# Altium project LTE-GNSS Asset Tracker.PrjPcb (part 2 of 3)

## Sheet 3-LTE Module.SchDoc: LTE Module
size A4; Organization: Unival Logistics; Address1: 550 S Hill St.; Address2: Suite 1607; Address3: Los Angeles, CA 90013; Revision: A; SheetNumber: 4; SheetTotal: 6
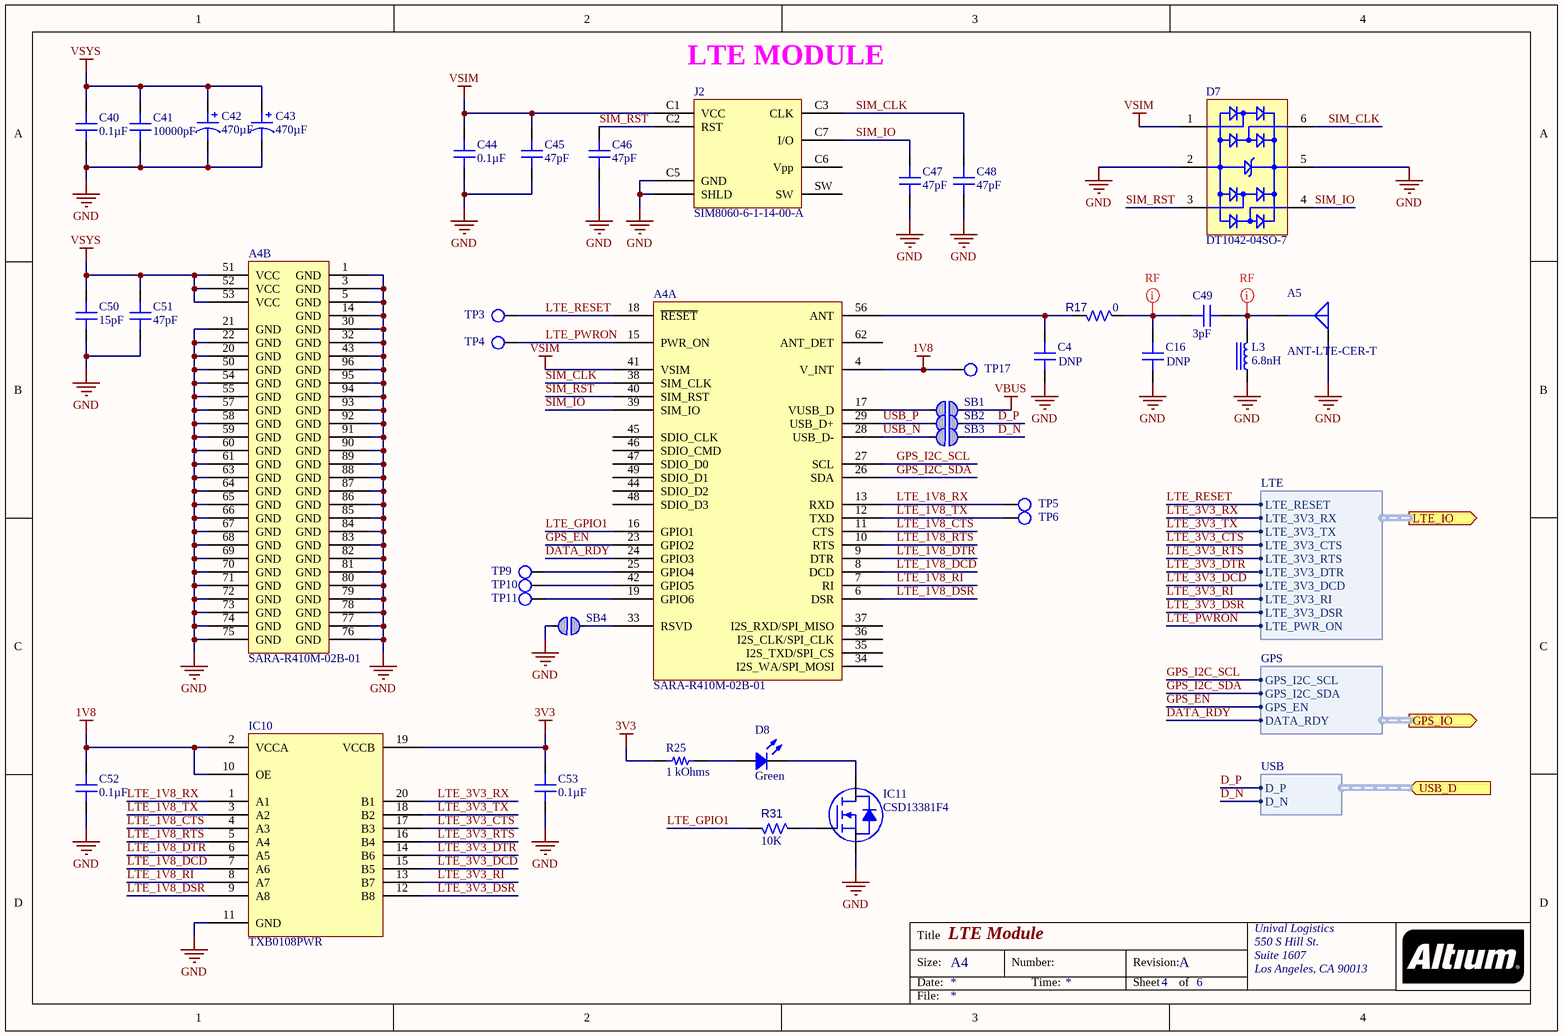
[diagram p2: 3-LTE Module.SchDoc]

### Parts
A4  SARA-R410M-02B-01  [U-BLOX SARA-R4]  (parts A,B of 2)
A5  ANT-LTE-CER-T  [LINX ANT-LTE-CER-T]
C4  DNP  [CAP 0402_1005]
C16  DNP  [CAP 0402_1005]
C40  0.1µF  [CAP 0201_0603]
C41  10000pF  [CAP 0201_0603]
C42  470µF  [CAP POL 1411_3528]
C43  470µF  [CAP POL 1411_3528]
C44  0.1µF  [CAP 0201_0603]
C45  47pF  [CAP 0201_0603]
C46  47pF  [CAP 0201_0603]
C47  47pF  [CAP 0201_0603]
C48  47pF  [CAP 0201_0603]
C49  3pF  [CAP 0402_1005]
C50  15pF  [CAP 0201_0603]
C51  47pF  [CAP 0201_0603]
C52  0.1µF  [CAP 0201_0603]
C53  0.1µF  [CAP 0201_0603]
D7  DT1042-04SO-7  [DIODES SOT-23-6 W6]
D8  Green  [LED 0402_1005 GREEN]
IC10  TXB0108PWR  [TI TSSOP-20 PW]
IC11  CSD13381F4  [TI 3-XFDFN F4 YJC]
J2  SIM8060-6-1-14-00-A  [GCT SIM8060-6-1-14-00-A]
L3  6.8nH  [IND 0402_1005 RF WW]
R17  0  [CAP 0402_1005]
R25  1 kOhms  [RES 0201_0603]
R31  10K  [RES 0201_0603]
SB1  Solderbridge  [Solderbridge]  (value not drawn)  (no BOM)
SB2  Solderbridge  [Solderbridge]  (value not drawn)  (no BOM)
SB3  Solderbridge  [Solderbridge]  (value not drawn)  (no BOM)
SB4  Solderbridge  [Solderbridge]  (value not drawn)  (no BOM)
TP3  Test Point  [Test Point]  (value not drawn)  (no BOM)
TP4  Test Point  [Test Point]  (value not drawn)  (no BOM)
TP5  Test Point  [Test Point]  (value not drawn)  (no BOM)
TP6  Test Point  [Test Point]  (value not drawn)  (no BOM)
TP9  Test Point  [Test Point]  (value not drawn)  (no BOM)
TP10  Test Point  [Test Point]  (value not drawn)  (no BOM)
TP11  Test Point  [Test Point]  (value not drawn)  (no BOM)
TP17  Test Point  [Test Point]  (value not drawn)  (no BOM)

### Ports
GPS_IO (out, harness GPS), LTE_IO (out, harness LTE), USB_D (in, harness USB)

### Harnesses
LTE: LTE_RESET, LTE_3V3_RX, LTE_3V3_TX, LTE_3V3_CTS, LTE_3V3_RTS, LTE_3V3_DTR, LTE_3V3_DCD, LTE_3V3_RI, LTE_3V3_DSR, LTE_PWR_ON
GPS: GPS_I2C_SCL, GPS_I2C_SDA, GPS_EN, DATA_RDY
USB: D_P, D_N

### Nets
1V8: A4.4(V_INT) C52.2 IC10.2(VCCA) IC10.10(OE) TP17.1(TP)
3V3: C53.2 IC10.19(VCCB) R25.1
GND: A4.1(GND) A4.3(GND) A4.5(GND) A4.14(GND) A4.20(GND) A4.21(GND) A4.22(GND) A4.30(GND) A4.32(GND) A4.43(GND) A4.50(GND) A4.54(GND) A4.55(GND) A4.57(GND) A4.58(GND) A4.59(GND) A4.60(GND) A4.61(GND) A4.63(GND) A4.64(GND) A4.65(GND) A4.66(GND) A4.67(GND) A4.68(GND) A4.69(GND) A4.70(GND) A4.71(GND) A4.72(GND) A4.73(GND) A4.74(GND) A4.75(GND) A4.76(GND) A4.77(GND) A4.78(GND) A4.79(GND) A4.80(GND) A4.81(GND) A4.82(GND) A4.83(GND) A4.84(GND) A4.85(GND) A4.86(GND) A4.87(GND) A4.88(GND) A4.89(GND) A4.90(GND) A4.91(GND) A4.92(GND) A4.93(GND) A4.94(GND) A4.95(GND) A4.96(GND) A5.G C4.1 C16.1 C40.1 C41.1 C42.2 C43.2 C44.1 C45.1 C46.1 C47.1 C48.1 C50.1 C51.1 C52.1 C53.1 D7.2(GND) D7.5(VBUS) IC10.11(GND) IC11.S J2.C5(GND) J2.S(SHLD) L3.1 SB4.2
VBUS: SB1.1
VSIM: A4.41(VSIM) C44.2 C45.2 D7.1(I/O_1) J2.C1(VCC)
VSYS: A4.51(VCC) A4.52(VCC) A4.53(VCC) C40.2 C41.2 C42.1 C43.1 C50.2 C51.2
D_N: SB3.1 ; port USB_D.D_N
D_P: SB2.1 ; port USB_D.D_P
DATA_RDY: A4.24(GPIO3) ; port GPS_IO.DATA_RDY
GPS_EN: A4.23(GPIO2) ; port GPS_IO.GPS_EN
GPS_I2C_SCL: A4.27(SCL) ; port GPS_IO.GPS_I2C_SCL
GPS_I2C_SDA: A4.26(SDA) ; port GPS_IO.GPS_I2C_SDA
LTE_1V8_CTS: A4.11(CTS) IC10.4(A3)
LTE_1V8_DCD: A4.8(DCD) IC10.7(A6)
LTE_1V8_DSR: A4.6(DSR) IC10.9(A8)
LTE_1V8_DTR: A4.9(DTR) IC10.6(A5)
LTE_1V8_RI: A4.7(RI) IC10.8(A7)
LTE_1V8_RTS: A4.10(RTS) IC10.5(A4)
LTE_1V8_RX: A4.13(RXD) IC10.1(A1) TP5.1(TP)
LTE_1V8_TX: A4.12(TXD) IC10.3(A2) TP6.1(TP)
LTE_3V3_CTS: IC10.17(B3) ; port LTE_IO.LTE_3V3_CTS
LTE_3V3_DCD: IC10.15(B5) ; port LTE_IO.LTE_3V3_DCD
LTE_3V3_DSR: IC10.12(B8) ; port LTE_IO.LTE_3V3_DSR
LTE_3V3_DTR: IC10.14(B6) ; port LTE_IO.LTE_3V3_DTR
LTE_3V3_RI: IC10.13(B7) ; port LTE_IO.LTE_3V3_RI
LTE_3V3_RTS: IC10.16(B4) ; port LTE_IO.LTE_3V3_RTS
LTE_3V3_RX: IC10.20(B1) ; port LTE_IO.LTE_3V3_RX
LTE_3V3_TX: IC10.18(B2) ; port LTE_IO.LTE_3V3_TX
LTE_GPIO1: A4.16(GPIO1) R31.1
LTE_PWRON: A4.15(PWR_ON) TP4.1(TP) ; port LTE_IO.LTE_PWR_ON
LTE_RESET: A4.18(~{RESET}) TP3.1(TP) ; port LTE_IO.LTE_RESET
SIM_CLK: A4.38(SIM_CLK) C48.2 D7.6(I/O_4) J2.C3(CLK)
SIM_IO: A4.39(SIM_IO) C47.2 D7.4(I/O_3) J2.C7(I/O)
SIM_RST: A4.40(SIM_RST) C46.2 D7.3(I/O_2) J2.C2(RST)
USB_N: A4.28(USB_D-) SB3.2
USB_P: A4.29(USB_D+) SB2.2
NetA4_17: A4.17(VUSB_D) SB1.2
NetA4_19: A4.19(GPIO6) TP11.1(TP)
NetA4_25: A4.25(GPIO4) TP9.1(TP)
NetA4_33: A4.33(RSVD) SB4.1
NetA4_42: A4.42(GPIO5) TP10.1(TP)
NetA4_56: A4.56(ANT) C4.2 R17.2
NetA5_S: A5.S C49.2 L3.2
NetC16_2: C16.2 C49.1 R17.1
NetD8_1: D8.1 R25.2
NetD8_2: D8.2 IC11.D
NetIC11_G: IC11.G R31.2

Not connected (* = marked no-connect by the designer): A4 34(I2S_WA/SPI_MOSI) 35(I2S_TXD/SPI_CS) 36(I2S_CLK/SPI_CLK) 37(I2S_RXD/SPI_MISO) 44(SDIO_D2) 45(SDIO_CLK) 46(SDIO_CMD) 47(SDIO_D0) 48(SDIO_D3) 49(SDIO_D1) 62(ANT_DET); J2 C6(Vpp) SW

### Layout directives
net class RF: NetA5_S, NetC16_2

### Notes on the sheet
- (near J2) LTE MODULE
- Title
- Size:
- Date:
- A4
- Number:
- Time:
- Revision:
- Sheet
- of
- File:

### Library data of the parts
A4 = U-BLOX SARA-R410M-02B-01: RF TXRX CELL 4G LTE CATM1/NB-IOT; Manufacturer: U-Blox America Inc.; Antenna Type: Antenna Not Included, Castellation; Current - Transmitting: 100mA ~ 490mA; Frequency: 700MHz, 850MHz, 1.7GHz, 1.9GHz; RF Family/Standard: Cellular; Sensitivity: -107.5dBm; Serial Interfaces: I²C, SPI, UART, USB; Voltage - Supply: 3.2V ~ 4.2V; Part Number: SARA-R410M-02B-01; ComponentLink1Description: Datasheet; ComponentLink1URL: https://www.u-blox.com/sites/default/files/SARA-R4-N4_DataSheet_%28UBX-16024152%29.pdf; ComponentLink2Description: DigiKey Link; ComponentLink2URL: http://digikey.com/product-detail/en/u-blox-america-inc/SARA-R410M-02B-01/672-SARA-R410M-02B-01CT-ND/9565823; Device Package: 96-SMD Module; LastUpdated: 31/01/2020 01:23:17; Lifecycle Status: Active; Minimum Order: 1; Mounting Type: Surface Mount; Operating Temperature: -40°C ~ 85°C; Package / Case: 96-SMD Module; Packaging: TapeAndReel; Part Status: Active; Price: 21.39; Protocol: 4G LTE CAT M1/NB-IoT; Series: SARA-R4; Supplier 1: DigiKey; Supplier Part Number 1: 672-SARA-R410M-02B-01CT-ND
A5 = Basic Antenna: RF ANT 829MHZ/1.94GHZ CHIP SLD; Manufacturer: Linx Technologies Inc.; Frequency (Center/Band): 829MHz, 1.94GHz, 2.35GHz, 2.6GHz; Frequency Group: Wide Band; Frequency Range: 698MHz ~ 960MHz, 1.71GHz ~ 2.17GHz, 2.3GHz ~ 2.4GHz, 2.5GHz ~ 2.7GHz; Gain: 4dBi; Number of Bands: 4; RF Family/Standard: Cellular; VSWR: 4, 3.2, 2.5, 2.5; Part Number: ANT-LTE-CER-T; Antenna Type: Chip; Applications: CAT-M1, Cellular, LTE, NB-IOT, 3G, 4G; ComponentLink1Description: Datasheet; ComponentLink1URL: https://linxtechnologies.com/wp/wp-content/uploads/ant-lte-cer.pdf; ComponentLink2Description: DigiKey Link; ComponentLink2URL: http://digikey.com/product-detail/en/linx-technologies-inc/ANT-LTE-CER-T/ANT-LTE-CER-TCT-ND/8556788; Height (Max): 0.203" (5.15mm); LastUpdated: 30/03/2020 15:23:26; Lifecycle Status: Active; Minimum Order: 1; Mounting Type: Surface Mount; Packaging: TapeAndReel; Part Status: Active; Price: 3.43; Series: CER; Supplier 1: DigiKey; Supplier Part Number 1: ANT-LTE-CER-TCT-ND; Termination: Solder
C4 C16 = Capacitor: CAP CER 3PF 50V C0G/NP0 0402; ComponentLink1Description: Datasheet; ComponentLink1URL: https://search.murata.co.jp/Ceramy/image/img/A01X/G101/ENG/GJM0335C1E3R0CB01-01.pdf; ComponentLink2Description: DigiKey Link; ComponentLink2URL: http://digikey.com/product-detail/en/murata-electronics/GJM0335C1E3R0CB01D/490-3064-1-ND/702330; Features: High Q, Low Loss; Lifecycle Status: Active; Minimum Order: 1; Mounting Type: Surface Mount, MLCC; Operating Temperature: -55°C ~ 125°C; Package / Case: 0402 (1005 Metric); Supplier 1: DigiKey
C40 C44 C52 C53 = Capacitor: CAP CER 0.1UF 16V X5R 0201; Part Number: GRM033R61C104ME84D; Manufacturer: Murata Electronics; Tolerance: ±20%; Value: 0.1µF; Applications: General Purpose; Capacitance: 0.1µF; ComponentLink1Description: Datasheet; ComponentLink1URL: https://search.murata.co.jp/Ceramy/image/img/A01X/G101/ENG/GRM033R61C104ME84-01.pdf; ComponentLink2Description: DigiKey Link; ComponentLink2URL: http://digikey.com/product-detail/en/murata-electronics/GRM033R61C104ME84D/490-9986-1-ND/5026291; Device Package: 0201 (0603 Metric); LastUpdated: 21/01/2020 00:00:12; Lifecycle Status: Active; Minimum Order: 1; Mounting Type: Surface Mount, MLCC; Operating Temperature: -55°C ~ 85°C; Package / Case: 0201 (0603 Metric); Packaging: TapeAndReel; PartId: 1522; Part Status: Active; Price: 0.01; Series: GRM; Size / Dimension: 0.024" L x 0.012" W (0.60mm x 0.30mm); Supplier 1: DigiKey; Supplier Part Number 1: 490-9986-1-ND; Temperature Coefficient: X5R; Thickness (Max): 0.013" (0.33mm); Voltage - Rated: 16V
C41 = Capacitor: CAP CER 10000PF 6.3V X7R 0201; Part Number: CGA1A2X7R0J103M030BA; Manufacturer: TDK Corporation; Tolerance: ±20%; Value: 10000pF; Applications: Automotive; Capacitance: 10000pF; ComponentLink1Description: Datasheet; ComponentLink1URL: https://product.tdk.com/info/en/catalog/datasheets/mlcc_automotive_general_en.pdf?ref_disty=digikey; ComponentLink2Description: DigiKey Link; ComponentLink2URL: http://digikey.com/product-detail/en/tdk-corporation/CGA1A2X7R0J103M030BA/445-12116-1-ND/3953782; Device Package: 0201 (0603 Metric); LastUpdated: 21/01/2020 00:00:11; Lifecycle Status: Active; Minimum Order: 1; Mounting Type: Surface Mount, MLCC; Operating Temperature: -55°C ~ 125°C; Package / Case: 0201 (0603 Metric); Packaging: TapeAndReel; PartId: 1683; Part Status: Active; Price: 0.01; Ratings: AEC-Q200; Series: CGA; Size / Dimension: 0.024" L x 0.012" W (0.60mm x 0.30mm); Supplier 1: DigiKey; Supplier Part Number 1: 445-12116-1-ND; Temperature Coefficient: X7R; Thickness (Max): 0.013" (0.33mm); Voltage - Rated: 6.3V
C42 C43 = Polarised Capacitor: CAP TANT 470UF 20% 6.3V 1411; Part Number: F950J477MBAAQ2; Manufacturer: AVX Corporation; Manufacturer Size Code: B; ESR (Equivalent Series Resistance): 500mOhm @ 100kHz; Lifetime @ Temp.: 2000 Hrs @ 85°C; Type: Conformal Coated; Value: 470µF; Capacitance: 470µF; ComponentLink1Description: Datasheet; ComponentLink1URL: http://datasheets.avx.com/F95.pdf; ComponentLink2Description: DigiKey Link; ComponentLink2URL: http://digikey.com/product-detail/en/avx-corporation/F950J477MBAAQ2/478-10647-1-ND/7423938; Device Package: 1411 (3528 Metric); Features: General Purpose; Height - Seated (Max): 0.079" (2.00mm); LastUpdated: 21/01/2020 01:52:25; Lifecycle Status: Active; Minimum Order: 1; Mounting Type: Surface Mount; Operating Temperature: -55°C ~ 125°C; Package / Case: 1411 (3528 Metric); Packaging: TapeAndReel; PartId: 2180; Part Status: Active; Price: 0.63; Series: F95, Frameless™; Size / Dimension: 0.138" L x 0.110" W (3.50mm x 2.80mm); Supplier 1: DigiKey; Supplier Part Number 1: 478-10647-1-ND; Tolerance: ±20%; Voltage - Rated: 6.3V
C45-C48 C51 = Capacitor: CAP CER 47PF 25V NP0 0201; Part Number: C0201C470K3GAC7867; Manufacturer: KEMET; Temperature Coefficient: C0G, NP0; Tolerance: ±10%; Value: 47pF; Applications: General Purpose; Capacitance: 47pF; ComponentLink1Description: Datasheet; ComponentLink1URL: https://api.kemet.com/component-edge/download/datasheet/C0201C470K3GAC7867.pdf; ComponentLink2Description: DigiKey Link; ComponentLink2URL: http://digikey.com/product-detail/en/kemet/C0201C470K3GAC7867/399-14263-1-ND/6827254; Device Package: 0201 (0603 Metric); Features: Low ESL; LastUpdated: 21/01/2020 00:00:12; Lifecycle Status: Active; Minimum Order: 1; Mounting Type: Surface Mount, MLCC; Operating Temperature: -55°C ~ 125°C; Package / Case: 0201 (0603 Metric); Packaging: TapeAndReel; PartId: 1548; Part Status: Active; Price: 0.01; Series: SMD Comm C0G; Size / Dimension: 0.024" L x 0.012" W (0.60mm x 0.30mm); Supplier 1: DigiKey; Supplier Part Number 1: 399-14263-1-ND; Thickness (Max): 0.013" (0.33mm); Voltage - Rated: 25V
C49 = Capacitor: CAP CER 3PF 50V C0G/NP0 0402; Part Number: GRM1555C1H3R0CA01D; Manufacturer: Murata Electronics; Temperature Coefficient: C0G, NP0; Tolerance: ±0.25pF; Applications: RF, Microwave, High Frequency; Capacitance: 3pF; ComponentLink1Description: Datasheet; ComponentLink1URL: https://search.murata.co.jp/Ceramy/image/img/A01X/G101/ENG/GJM0335C1E3R0CB01-01.pdf; ComponentLink2Description: DigiKey Link; ComponentLink2URL: http://digikey.com/product-detail/en/murata-electronics/GJM0335C1E3R0CB01D/490-3064-1-ND/702330; Features: High Q, Low Loss; LastUpdated: 21/01/2020 02:09:19; Lifecycle Status: Active; Minimum Order: 1; Mounting Type: Surface Mount, MLCC; Operating Temperature: -55°C ~ 125°C; Package / Case: 0402 (1005 Metric); Packaging: TapeAndReel; PartId: 337; Part Status: Active; Price: 0.01; Series: GRM; Supplier 1: DigiKey; Supplier Part Number 1: 490-5872-2-ND; Thickness (Max): 0.013" (0.33mm); Value: 3pF; Voltage - Rated: 50V
C50 = Capacitor: CAP CER 15PF 25V C0G 0201; Part Number: CGA1A2C0G1E150J030BA; Manufacturer: TDK Corporation; Temperature Coefficient: C0G, NP0; Tolerance: ±5%; Value: 15pF; Applications: Automotive; Capacitance: 15pF; ComponentLink1Description: Datasheet; ComponentLink1URL: https://product.tdk.com/info/en/catalog/datasheets/mlcc_automotive_general_en.pdf?ref_disty=digikey; ComponentLink2Description: DigiKey Link; ComponentLink2URL: http://digikey.com/product-detail/en/tdk-corporation/CGA1A2C0G1E150J030BA/445-9034-1-ND/3648614; Device Package: 0201 (0603 Metric); LastUpdated: 21/01/2020 00:00:11; Lifecycle Status: Active; Minimum Order: 1; Mounting Type: Surface Mount, MLCC; Operating Temperature: -55°C ~ 125°C; Package / Case: 0201 (0603 Metric); Packaging: TapeAndReel; PartId: 1675; Part Status: Active; Price: 0.01; Ratings: AEC-Q200; Series: CGA; Size / Dimension: 0.024" L x 0.012" W (0.60mm x 0.30mm); Supplier 1: DigiKey; Supplier Part Number 1: 445-9034-1-ND; Thickness (Max): 0.013" (0.33mm); Voltage - Rated: 25V
D7 = DIODES SOT-23-6: TVS DIODE 5V 9V SOT26; Manufacturer: Diodes Incorporated; Current - Peak Pulse (10/1000µs): 6A (8/20µs); Power Line Protection: Yes; Power - Peak Pulse: 55W; Type: Steering (Rail to Rail); Unidirectional Channels: 4; Voltage - Breakdown (Min): 6.2V; Voltage - Reverse Standoff (Typ): 5V (Max); Part Number: DT1042-04SO-7; Applications: HDMI; ComponentLink1Description: Datasheet; ComponentLink1URL: https://www.diodes.com/assets/Datasheets/DT1042-04SO.pdf; ComponentLink2Description: DigiKey Link; ComponentLink2URL: http://digikey.com/product-detail/en/diodes-incorporated/DT1042-04SO-7/DT1042-04SO-7DICT-ND/4457893; Device Package: SOT-23-6; LastUpdated: 30/03/2020 16:25:53; Lifecycle Status: Active; Minimum Order: 1; Mounting Type: Surface Mount; Operating Temperature: -55°C ~ 85°C (TA); Package / Case: SOT-23-6; Packaging: TapeAndReel; PartId: 10505; Part Status: Active; Price: 0.08; Series: -; Supplier 1: DigiKey; Supplier Part Number 1: DT1042-04SO-7DICT-ND; Supplier Device Package: SOT-26; Voltage - Clamping (Max) @ Ipp: 9V
D8 = LED: LED GREEN CLEAR 0402 SMD; Part Number: QBLP595-IG; Manufacturer: QT Brightek (QTB); Configuration: Standard; Current - Test: 20mA; Lens Color: Colorless; Lens Size: 0.70mm x 0.50mm; Lens Style: Rectangle with Flat Top; Millicandela Rating: 600mcd; Viewing Angle: 140°; Voltage - Forward (Vf) (Typ): 3.1V; Wavelength - Dominant: 520nm; Color: Green; ComponentLink1Description: Datasheet; ComponentLink1URL: http://www.qt-brightek.com/datasheet/QBLP595 Series.pdf; ComponentLink2Description: DigiKey Link; ComponentLink2URL: http://digikey.com/product-detail/en/qt-brightek-qtb/QBLP595-IG/1516-1216-1-ND/6201913; Device Package: 0402 (1005 Metric); Height (Max): 0.60mm; LastUpdated: 21/01/2020 03:11:39; Lens Transparency: Clear; Lifecycle Status: Active; Minimum Order: 1; Mounting Type: Surface Mount; Package / Case: 0402 (1005 Metric); Packaging: TapeAndReel; PartId: 717; Part Status: Active; Price: 0.08; Series: QBLP595; Size / Dimension: 1.00mm L x 0.50mm W; Supplier 1: DigiKey; Supplier Part Number 1: 1516-1216-1-ND; Supplier Device Package: 0402; Value: Green
IC10 = TI TXB0108PWR: IC TRNSLTR BIDIRECTIONAL 20TSSOP; Manufacturer: Texas Instruments; Channels per Circuit: 8; Data Rate: 100Mbps; Number of Circuits: 1; Output Type: Tri-State, Non-Inverted; Translator Type: Voltage Level; Voltage - VCCA: 1.2V ~ 3.6V; Voltage - VCCB: 1.65V ~ 5.5V; Part Number: TXB0108PWR; Channel Type: Bidirectional; ComponentLink1Description: Datasheet; ComponentLink1URL: http://www.ti.com/general/docs/suppproductinfo.tsp?distId=10&gotoUrl=http%3A%2F%2Fwww.ti.com%2Flit%2Fgpn%2Ftxb0108; ComponentLink2Description: DigiKey Link; ComponentLink2URL: http://digikey.com/product-detail/en/texas-instruments/TXB0108PWR/296-21527-1-ND/1305700; Device Package: 20-TSSOP (0.173", 4.40mm Width); Features: Auto-Direction Sensing; LastUpdated: 30/03/2020 16:25:06; Lifecycle Status: Active; Minimum Order: 1; Mounting Type: Surface Mount; Operating Temperature: -40°C ~ 85°C (TA); Package / Case: 20-TSSOP (0.173", 4.40mm Width); Packaging: TapeAndReel; Part Status: Active; Price: 0.69; Series: -; Supplier 1: DigiKey; Supplier Part Number 1: 296-21527-1-ND; Supplier Device Package: 20-TSSOP
IC11 = TI CSD MOSFET N-CH F4: MOSFET N-CH 12V 2.1A 3PICOSTAR; Manufacturer: Texas Instruments; Current - Continuous Drain (Id) @ 25°C: 2.1A (Ta); Drive Voltage (Max Rds On,  Min Rds On): 1.8V, 4.5V; FET Type: N-Channel; Gate Charge (Qg) (Max) @ Vgs: 1.4nC @ 4.5V; Input Capacitance (Ciss) (Max) @ Vds: 200pF @ 6V; Power Dissipation (Max): 500mW (Ta); Rds On (Max) @ Id, Vgs: 180mOhm @ 500mA, 4.5V; Vgs (Max): 8V; Vgs(th) (Max) @ Id: 1.1V @ 250µA; Part Number: CSD13381F4; ComponentLink1Description: Datasheet; ComponentLink1URL: http://www.ti.com/general/docs/suppproductinfo.tsp?distId=10&gotoUrl=http%3A%2F%2Fwww.ti.com%2Flit%2Fgpn%2Fcsd13381f4; ComponentLink2Description: DigiKey Link; ComponentLink2URL: http://digikey.com/product-detail/en/texas-instruments/CSD13381F4/296-38912-1-ND/5143018; Device Package: 3-XFDFN; Drain to Source Voltage (Vdss): 12V; LastUpdated: 30/03/2020 15:00:54; Lifecycle Status: Active; Minimum Order: 1; Mounting Type: Surface Mount; Operating Temperature: -55°C ~ 150°C (TJ); Package / Case: 3-XFDFN; Packaging: TapeAndReel; Part Status: Active; Price: 0.07; Series: NexFET™; Supplier 1: DigiKey; Supplier Part Number 1: 296-38912-1-ND; Supplier Device Package: 3-PICOSTAR; Technology: MOSFET (Metal Oxide)
J2 = GCT SIM8060-6-1-14-00-A: CONN SIM NANO HINGED 6P W/SWITCH; Manufacturer: GCT; Card Type: NANO SIM; Connector Type: Connector and Ejector; Insertion, Removal Method: Hinged Lid; Number of Positions: 6; Part Number: SIM8060-6-1-14-00-A; ComponentLink1Description: Datasheet; ComponentLink1URL: https://gct.co/files/drawings/sim8060.pdf; ComponentLink2Description: DigiKey Link; ComponentLink2URL: http://digikey.com/product-detail/en/gct/SIM8060-6-1-14-00-A/2073-SIM8060-6-1-14-00-ACT-ND/10127236; Contact Finish: Gold; Contact Finish Thickness: 1.00µin (0.025µm); Height Above Board: 0.056" (1.42mm); LastUpdated: 30/03/2020 15:26:01; Lifecycle Status: Active; Minimum Order: 1; Mounting Feature: Normal, Standard - Top; Mounting Type: Surface Mount, Right Angle; Packaging: TapeAndReel; Part Status: Active; Price: 0.70; Series: SIM8060; Supplier 1: DigiKey; Supplier Part Number 1: 2073-SIM8060-6-1-14-00-ACT-ND
L3 = Inductor: FIXED IND 6.8NH 1.45A 68 MOHM; Part Number: LQW15AN6N8J8ZD; Manufacturer: Murata Electronics; DC Resistance (DCR): 68mOhm Max; Frequency - Self Resonant: 7GHz; Inductance Frequency - Test: 100MHz; Material - Core: Non-Magnetic; Q @ Freq: 30 @ 250MHz; Shielding: Unshielded; Tolerance: ±5%; Type: Wirewound; ComponentLink1Description: Datasheet; ComponentLink1URL: https://search.murata.co.jp/Ceramy/image/img/P02/JELF243A-9138.pdf; ComponentLink2Description: DigiKey Link; ComponentLink2URL: http://digikey.com/product-detail/en/murata-electronics/LQW15AN6N8J8ZD/490-15562-1-ND/6800227; Current Rating (Amps): 1.45A; Device Package: 0402 (1006 Metric); Height - Seated (Max): 0.024" (0.60mm); Inductance: 6.8nH; LastUpdated: 21/01/2020 03:29:12; Lifecycle Status: Active; Minimum Order: 1; Mounting Type: Surface Mount; Operating Temperature: -55°C ~ 125°C; Package / Case: 0402 (1006 Metric); Packaging: TapeAndReel; PartId: 139; Part Status: Active; Price: 0.07; Ratings: AEC-Q200; Series: LQW15; Size / Dimension: 0.039" L x 0.024" W (1.00mm x 0.60mm); Supplier 1: DigiKey; Supplier Part Number 1: 490-15562-1-ND; Value: 6.8nH
R17 = RSMT0626: RES SMD 0 OHM JUMPER 1/16W 0402; Part Number: RC0402JR-070RP; Manufacturer: Yageo; Value: 0; Supplier Part Number 1: YAG1279TR-ND; ComponentLink1URL: https://chn-vm-apps.microchip.com/mchprepo/parts/Datasheets/AOA0000CE2.pdf; ComponentLink1Description: Datasheet; Supplier 1: Digi-Key
R25 = Resistor: RES SMD 1K OHM 1% 1/20W 0201; Part Number: ERJ-1GNF1001C; Manufacturer: Panasonic Electronic Components; Power (Watts): 0.05W, 1/20W; Temperature Coefficient: ±200ppm/°C; Value: 1 kOhms; ComponentLink1Description: Datasheet; ComponentLink1URL: https://industrial.panasonic.com/cdbs/www-data/pdf/RDA0000/AOA0000C304.pdf; ComponentLink2Description: DigiKey Link; ComponentLink2URL: http://digikey.com/product-detail/en/panasonic-electronic-components/ERJ-1GNF1001C/P122413CT-ND/7389439; Composition: Thick Film; Device Package: 0201 (0603 Metric); Features: Automotive AEC-Q200; Height - Seated (Max): 0.010" (0.26mm); LastUpdated: 21/01/2020 00:04:13; Lifecycle Status: Active; Minimum Order: 1; Number of Terminations: 2; Operating Temperature: -55°C ~ 125°C; Package / Case: 0201 (0603 Metric); Packaging: TapeAndReel; PartId: 2298; Part Status: Active; Price: 0.01; Ratings: AEC-Q200; Resistance: 1 kOhms; Series: ERJ; Size / Dimension: 0.024" L x 0.012" W (0.60mm x 0.30mm); Supplier 1: DigiKey; Supplier Part Number 1: P122413CT-ND; Supplier Device Package: 0201; Tolerance: ±1%
R31 = RSMT0626: RES SMD 10K OHM 1% 1/20W 0201; Part Number: RC0201FR-0710KL; Manufacturer: Yageo; Value: 10K; Supplier Part Number 1: 311-10.0KMTR-ND; ComponentLink1URL: https://chn-vm-apps.microchip.com/mchprepo/parts/Datasheets/AOA0000CE2.pdf; ComponentLink1Description: Datasheet; Supplier 1: Digi-Key
SB1-SB4 = Solderbridge: Artikkelnr Noca: N.A.; Part Number: Solderbridge; Manufacturer: *; Manufacturer Part Number: *; Datasheet: *; LatestRevisionDate: 2009-12-14; Pin Count: 2; Publisher: Nordic Semiconductor; Published: 2009-12-14; Value: Solderbridge; Note: *; Supplier: *; Supplier part number: *; 2nd source Supplier: *; 2nd source part number: *; Footprint Doc: Solderbridge; Artikkelnr Simpro: N.A.

## Sheet 4-GPS.SchDoc: GPS Module
size A4; Organization: Unival Logistics; Address1: 550 S Hill St.; Address2: Suite 1607; Address3: Los Angeles, CA 90013; Revision: A; SheetNumber: 5; SheetTotal: 6
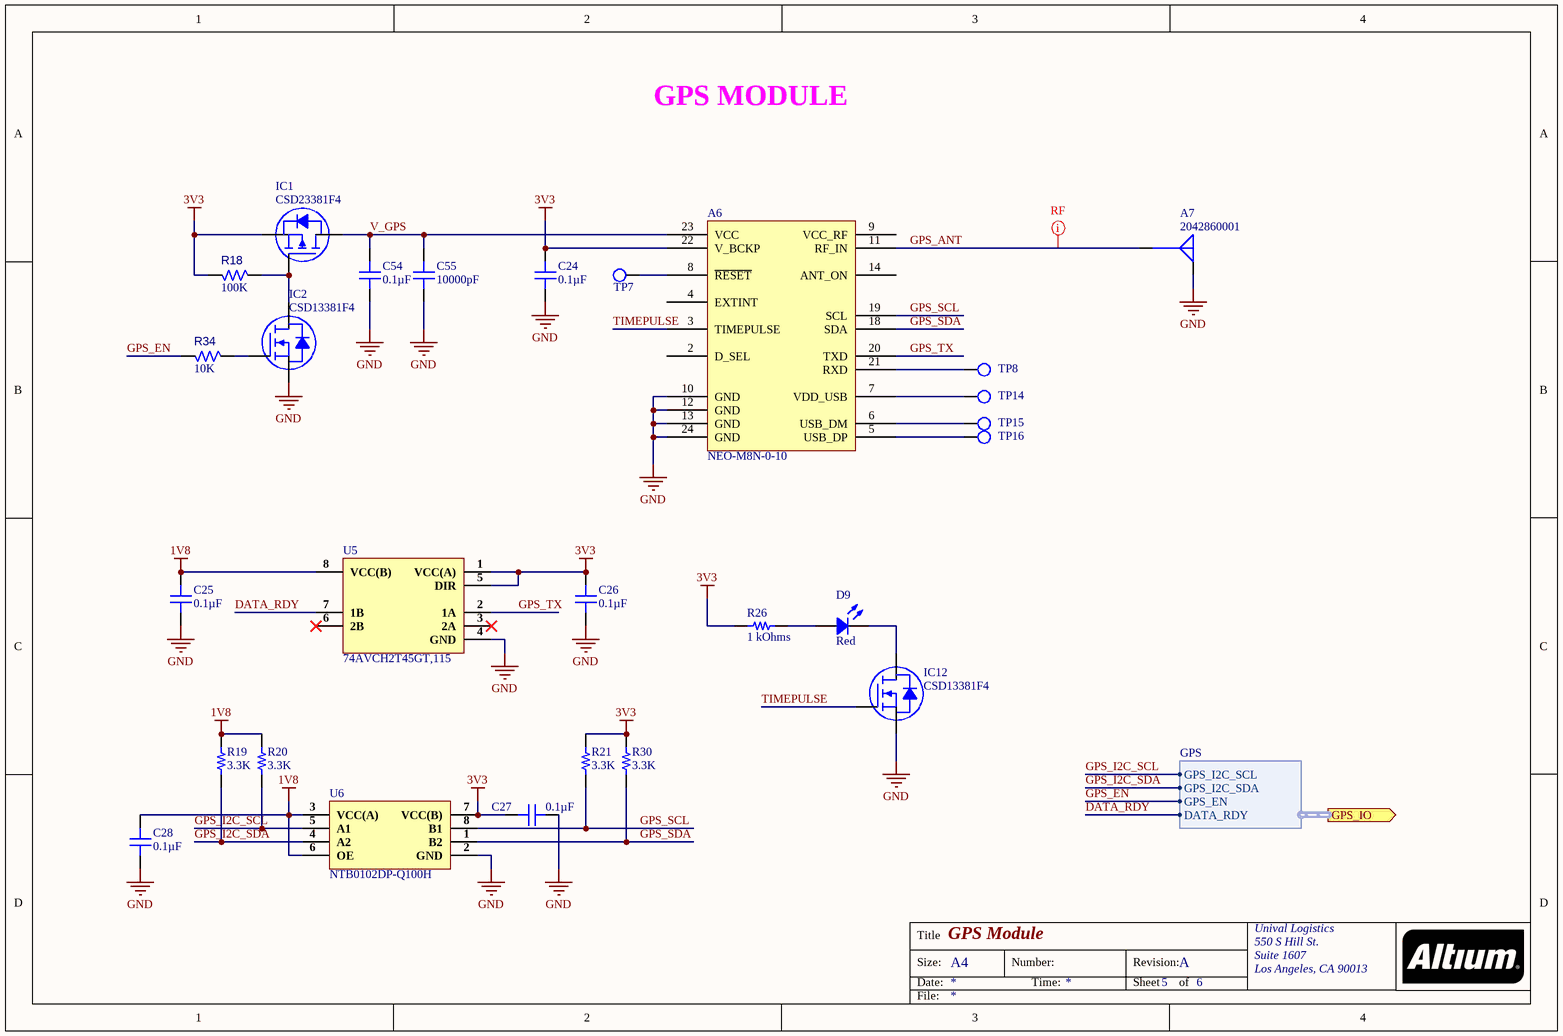
[diagram p3: 4-GPS.SchDoc]

### Parts
A6  NEO-M8N-0-10  [U-BLOX NEO-M8N]
A7  2042860001  [MOLEX 2042860001]
C24  0.1µF  [CAP 0201_0603]
C25  0.1µF  [CAP 0201_0603]
C26  0.1µF  [CAP 0201_0603]
C27  0.1µF  [CAP 0201_0603]
C28  0.1µF  [CAP 0201_0603]
C54  0.1µF  [CAP 0201_0603]
C55  10000pF  [CAP 0201_0603]
D9  Red  [LED 0402_1005 RED]
IC1  CSD23381F4  [TI 3-XFDFN F4 YJC]
IC2  CSD13381F4  [TI 3-XFDFN F4 YJC]
IC12  CSD13381F4  [TI 3-XFDFN F4 YJC]
R18  100K  [RES 0201_0603]
R19  3.3K  [RES 0201_0603]
R20  3.3K  [RES 0201_0603]
R21  3.3K  [RES 0201_0603]
R26  1 kOhms  [RES 0201_0603]
R30  3.3K  [RES 0201_0603]
R34  10K  [RES 0201_0603]
TP7  Test Point  [Test Point]  (value not drawn)  (no BOM)
TP8  Test Point  [Test Point]  (value not drawn)  (no BOM)
TP14  Test Point  [Test Point]  (value not drawn)  (no BOM)
TP15  Test Point  [Test Point]  (value not drawn)  (no BOM)
TP16  Test Point  [Test Point]  (value not drawn)  (no BOM)
U5  74AVCH2T45GT,115  [74AVCH2T45GT,115]
U6  NTB0102DP-Q100H  [NTB0102DP-Q100H]

### Ports
GPS_IO (out, harness GPS)

### Harnesses
GPS: GPS_I2C_SCL, GPS_I2C_SDA, GPS_EN, DATA_RDY

### Nets
1V8: C25.2 C28.2 R19.1 R20.1 U5.8(VCC(B)) U6.3(VCC(A)) U6.6(OE)
3V3: A6.22(V_BCKP) C24.2 C26.2 C27.2 IC1.S R18.2 R21.1 R26.1 R30.1 U5.1(VCC(A)) U5.5(DIR) U6.7(VCC(B))
GND: A6.10(GND) A6.12(GND) A6.13(GND) A6.24(GND) A7.G C24.1 C25.1 C26.1 C27.1 C28.1 C54.1 C55.1 IC2.S IC12.S U5.4(GND) U6.2(GND)
DATA_RDY: U5.7(1B) ; port GPS_IO.DATA_RDY
GPS_ANT: A6.11(RF_IN) A7.S
GPS_EN: R34.1 ; port GPS_IO.GPS_EN
GPS_I2C_SCL: R20.2 U6.5(A1) ; port GPS_IO.GPS_I2C_SCL
GPS_I2C_SDA: R19.2 U6.4(A2) ; port GPS_IO.GPS_I2C_SDA
GPS_SCL: A6.19(SCL) R21.2 U6.8(B1)
GPS_SDA: A6.18(SDA) R30.2 U6.1(B2)
GPS_TX: A6.20(TXD) U5.2(1A)
TIMEPULSE: A6.3(TIMEPULSE) IC12.G
V_GPS: A6.23(VCC) C54.2 C55.2 IC1.D
NetA6_5: A6.5(USB_DP) TP16.1(TP)
NetA6_6: A6.6(USB_DM) TP15.1(TP)
NetA6_7: A6.7(VDD_USB) TP14.1(TP)
NetA6_8: A6.8(~{RESET}) TP7.1(TP)
NetA6_21: A6.21(RXD) TP8.1(TP)
NetD9_1: D9.1 R26.2
NetD9_2: D9.2 IC12.D
NetIC1_G: IC1.G IC2.D R18.1
NetIC2_G: IC2.G R34.2

Not connected (* = marked no-connect by the designer): A6 2(D_SEL) 4(EXTINT) 9(VCC_RF) 14(ANT_ON); U5 3(2A)* 6(2B)*

### Layout directives
net class RF: GPS_ANT

### Notes on the sheet
- GPS MODULE
- Title
- Size:
- Date:
- A4
- Number:
- Time:
- Revision:
- Sheet
- of
- File:

### Library data of the parts
A6 = U-BLOX NEO-M8N: RF RCVR GNSS/GPS 1.575GHZ 24LCC; Manufacturer: U-Blox America Inc.; Current - Receiving: 21mA; Data Interface: I2C, SPI, UART, USB; Modulation or Protocol: BeiDou, Galileo, GLONASS, GNSS, GPS; Sensitivity: -167dBm; Voltage - Supply: 1.65V ~ 3.6V; Part Number: NEO-M8N-0-10; Applications: General Purpose; ComponentLink1Description: Datasheet; ComponentLink1URL: https://www.u-blox.com/sites/default/files/NEO-M8-FW3_DataSheet_%28UBX-15031086%29.pdf; ComponentLink2Description: DigiKey Link; ComponentLink2URL: http://digikey.com/product-detail/en/u-blox-america-inc/NEO-M8N-0-10/672-NEO-M8N-0-10CT-ND/6150671; Device Package: 24-SMD Module; Frequency: 1.575GHz; LastUpdated: 04/01/2020 00:19:34; Lifecycle Status: Active; Minimum Order: 1; Operating Temperature: -40°C ~ 85°C; Package / Case: 24-SMD Module; Packaging: ReReel; PartId: 3; Part Status: Active; Price: 0.00; Series: NEO-M8; Supplier 1: DigiKey; Supplier Part Number 1: 672-NEO-M8N-0-10CT-ND
A7 = Basic Antenna: RF ANT CER PATCH SOLDER SMD; Manufacturer: Molex; Antenna Type: Ceramic Patch; Frequency Group: UHF (1GHz ~ 2GHz); Gain: 5.5dBi; Number of Bands: 1; Return Loss: -10dB; RF Family/Standard: Navigation; Part Number: 2042860001; Applications: Beidou, GLONASS, GPS; ComponentLink1Description: Datasheet; ComponentLink1URL: http://www.literature.molex.com/SQLImages/kelmscott/Molex/PDF_Images/987651-5071.pdf; ComponentLink2Description: DigiKey Link; ComponentLink2URL: http://digikey.com/product-detail/en/molex/2042860001/WM16802-ND/7566910; Height (Max): 0.157" (4.00mm); LastUpdated: 12/12/2019 06:31:41; Lifecycle Status: 0; Minimum Order: 1; Mounting Type: Through Hole; Packaging: Tray; Part Status: Active; Price: 2.23; Series: *; Supplier 1: DigiKey; Supplier Part Number 1: WM16802-ND; Termination: Solder
C24-C28 C54 = Capacitor: as C40 on sheet 3-LTE Module; Value: 0.1µF; Applications: General Purpose; Capacitance: 0.1µF; ComponentLink1Description: Datasheet; ComponentLink1URL: https://search.murata.co.jp/Ceramy/image/img/A01X/G101/ENG/GRM033R61C104ME84-01.pdf; ComponentLink2Description: DigiKey Link; ComponentLink2URL: http://digikey.com/product-detail/en/murata-electronics/GRM033R61C104ME84D/490-9986-1-ND/5026291; Device Package: 0201 (0603 Metric); LastUpdated: 21/01/2020 00:00:12; Lifecycle Status: Active; Minimum Order: 1; Mounting Type: Surface Mount, MLCC; Operating Temperature: -55°C ~ 85°C; Package / Case: 0201 (0603 Metric); Packaging: TapeAndReel; PartId: 1522; Part Status: Active; Price: 0.01; Series: GRM; Size / Dimension: 0.024" L x 0.012" W (0.60mm x 0.30mm); Supplier 1: DigiKey; Supplier Part Number 1: 490-9986-1-ND; Temperature Coefficient: X5R; Thickness (Max): 0.013" (0.33mm); Voltage - Rated: 16V
C55 = Capacitor: as C41 on sheet 3-LTE Module; Value: 10000pF; Applications: Automotive; Capacitance: 10000pF; ComponentLink1Description: Datasheet; ComponentLink1URL: https://product.tdk.com/info/en/catalog/datasheets/mlcc_automotive_general_en.pdf?ref_disty=digikey; ComponentLink2Description: DigiKey Link; ComponentLink2URL: http://digikey.com/product-detail/en/tdk-corporation/CGA1A2X7R0J103M030BA/445-12116-1-ND/3953782; Device Package: 0201 (0603 Metric); LastUpdated: 21/01/2020 00:00:11; Lifecycle Status: Active; Minimum Order: 1; Mounting Type: Surface Mount, MLCC; Operating Temperature: -55°C ~ 125°C; Package / Case: 0201 (0603 Metric); Packaging: TapeAndReel; PartId: 1683; Part Status: Active; Price: 0.01; Ratings: AEC-Q200; Series: CGA; Size / Dimension: 0.024" L x 0.012" W (0.60mm x 0.30mm); Supplier 1: DigiKey; Supplier Part Number 1: 445-12116-1-ND; Temperature Coefficient: X7R; Thickness (Max): 0.013" (0.33mm); Voltage - Rated: 6.3V
D9 = LED: LED RED CLEAR 0402 SMD; Part Number: IN-S42ATR; Manufacturer: Inolux; Configuration: Standard; Current - Test: 20mA; Lens Size: 0.60mm x 0.45mm; Lens Style: Rectangle with Flat Top; Millicandela Rating: 90mcd; Viewing Angle: 130°; Voltage - Forward (Vf) (Typ): 2.1V; Wavelength - Dominant: 631nm; Wavelength - Peak: 645nm; Color: Red; ComponentLink1Description: Datasheet; ComponentLink1URL: http://www.inolux-corp.com/datasheet/SMDLED/Mono%20Color%20Top%20View/IN-S42AT%20Series_V1.1.pdf; ComponentLink2Description: DigiKey Link; ComponentLink2URL: http://digikey.com/product-detail/en/inolux/IN-S42ATR/1830-1057-1-ND/7604692; Device Package: 0402 (1005 Metric); Height (Max): 0.55mm; LastUpdated: 21/01/2020 03:12:45; Lens Color: Clear; Lens Transparency: Clear; Lifecycle Status: Active; Minimum Order: 1; Mounting Type: Surface Mount; Package / Case: 0402 (1005 Metric); Packaging: TapeAndReel; PartId: 504; Part Status: Active; Price: 0.06; Series: IN-S42AT; Size / Dimension: 1.00mm L x 0.50mm W; Supplier 1: DigiKey; Supplier Part Number 1: 1830-1057-1-ND; Supplier Device Package: 0402; Value: Red
IC1 = TI CSD MOSFET P-CH: MOSFET P-CH 12V 2.3A 3PICOSTAR; Current - Continuous Drain (Id) @ 25°C: 2.3A (Ta); Drive Voltage (Max Rds On,  Min Rds On): 1.8V, 4.5V; FET Type: P-Channel; Power Dissipation (Max): 500mW (Ta); Rds On (Max) @ Id, Vgs: 180mOhm @ 500mA, 4.5V; Vgs (Max): -8V; Vgs(th) (Max) @ Id: 1.2V @ 250µA; Part Number: CSD23381F4; ComponentLink1Description: Datasheet; ComponentLink1URL: http://www.ti.com/general/docs/suppproductinfo.tsp?distId=10&gotoUrl=http%3A%2F%2Fwww.ti.com%2Flit%2Fgpn%2Fcsd13381f4; ComponentLink2Description: DigiKey Link; ComponentLink2URL: http://digikey.com/product-detail/en/texas-instruments/CSD13381F4/296-38912-1-ND/5143018; Device Package: 3-XFDFN; Drain to Source Voltage (Vdss): 12V; Package / Case: 3-XFDFN; Packaging: TapeAndReel; Part Status: Active; Price: 0.07; Series: NexFET™; Supplier 1: DigiKey; Supplier Part Number 1: 296-40002-2-ND; Supplier Device Package: 3-PICOSTAR; Technology: MOSFET (Metal Oxide)
IC2 IC12 = TI CSD MOSFET N-CH F4: as IC11 on sheet 3-LTE Module; Part Number: CSD13381F4; ComponentLink1Description: Datasheet; ComponentLink1URL: http://www.ti.com/general/docs/suppproductinfo.tsp?distId=10&gotoUrl=http%3A%2F%2Fwww.ti.com%2Flit%2Fgpn%2Fcsd13381f4; ComponentLink2Description: DigiKey Link; ComponentLink2URL: http://digikey.com/product-detail/en/texas-instruments/CSD13381F4/296-38912-1-ND/5143018; Device Package: 3-XFDFN; Drain to Source Voltage (Vdss): 12V; LastUpdated: 30/03/2020 15:00:54; Lifecycle Status: Active; Minimum Order: 1; Mounting Type: Surface Mount; Operating Temperature: -55°C ~ 150°C (TJ); Package / Case: 3-XFDFN; Packaging: TapeAndReel; Part Status: Active; Price: 0.07; Series: NexFET™; Supplier 1: DigiKey; Supplier Part Number 1: 296-38912-1-ND; Supplier Device Package: 3-PICOSTAR; Technology: MOSFET (Metal Oxide)
R18 = RSMT0626: RES 100K OHM 1% 1/20W 0201; Part Number: RMCF0201FT100K; Manufacturer: Stackpole Electronics Inc; Value: 100K; Supplier Part Number 1: RMCF0201FT100KTR-ND; ComponentLink1URL: https://chn-vm-apps.microchip.com/mchprepo/parts/Datasheets/AOA0000CE2.pdf; ComponentLink1Description: Datasheet; Supplier 1: Digi-Key
R19-R21 R30 = Resistor: RES SMD 3.3K OHM 1% 1/20W 0201; Part Number: ERJ-1GNF3301C; Manufacturer: Panasonic Electronic Components; Power (Watts): 0.05W, 1/20W; Resistance: 3.3 kOhms; Temperature Coefficient: ±200ppm/°C; Value: 3.3K; ComponentLink1Description: Datasheet; ComponentLink1URL: https://industrial.panasonic.com/cdbs/www-data/pdf/RDA0000/AOA0000C304.pdf; ComponentLink2Description: DigiKey Link; ComponentLink2URL: http://digikey.com/product-detail/en/panasonic-electronic-components/ERJ-1GNF3301C/P122937CT-ND/8342813; Composition: Thick Film; Device Package: 0201 (0603 Metric); Features: Automotive AEC-Q200; Height - Seated (Max): 0.010" (0.26mm); LastUpdated: 21/01/2020 00:04:10; Lifecycle Status: Active; Minimum Order: 1; Number of Terminations: 2; Operating Temperature: -55°C ~ 125°C; Package / Case: 0201 (0603 Metric); Packaging: TapeAndReel; PartId: 4142; Part Status: Active; Price: 0.01; Ratings: AEC-Q200; Series: ERJ; Size / Dimension: 0.024" L x 0.012" W (0.60mm x 0.30mm); Supplier 1: DigiKey; Supplier Part Number 1: P122937CT-ND; Supplier Device Package: 0201; Tolerance: ±1%
R26 = Resistor: as R25 on sheet 3-LTE Module; Value: 1 kOhms; ComponentLink1Description: Datasheet; ComponentLink1URL: https://industrial.panasonic.com/cdbs/www-data/pdf/RDA0000/AOA0000C304.pdf; ComponentLink2Description: DigiKey Link; ComponentLink2URL: http://digikey.com/product-detail/en/panasonic-electronic-components/ERJ-1GNF1001C/P122413CT-ND/7389439; Composition: Thick Film; Device Package: 0201 (0603 Metric); Features: Automotive AEC-Q200; Height - Seated (Max): 0.010" (0.26mm); LastUpdated: 21/01/2020 00:04:13; Lifecycle Status: Active; Minimum Order: 1; Number of Terminations: 2; Operating Temperature: -55°C ~ 125°C; Package / Case: 0201 (0603 Metric); Packaging: TapeAndReel; PartId: 2298; Part Status: Active; Price: 0.01; Ratings: AEC-Q200; Resistance: 1 kOhms; Series: ERJ; Size / Dimension: 0.024" L x 0.012" W (0.60mm x 0.30mm); Supplier 1: DigiKey; Supplier Part Number 1: P122413CT-ND; Supplier Device Package: 0201; Tolerance: ±1%
R34 = RSMT0626: as R31 on sheet 3-LTE Module; Value: 10K; Supplier Part Number 1: 311-10.0KMTR-ND; ComponentLink1URL: https://chn-vm-apps.microchip.com/mchprepo/parts/Datasheets/AOA0000CE2.pdf; ComponentLink1Description: Datasheet; Supplier 1: Digi-Key
U5 = 74AVCH2T45GT,115: IC TXRX BUS 2BIT DUAL 3ST 8XSON; Manufacturer: Nexperia; Supplier 1: Digi-Key; Manufacturer Part Number: 74AVCH2T45GT,115; RoHS: Yes; Category: Voltage Level Shifters; Stock 1: 342616; Pricing 1: 5000=0.19239 (USD); RoHS Compliant: Yes; ComponentLink1URL: https://assets.nexperia.com/documents/data-sheet/74AVCH2T45.pdf?src-supplier=Digi-Key; ComponentLink1Description: https://assets.nexperia.com/documents/data-sheet/74AVCH2T45.pdf?src-supplier=Digi-Key; Supplier Part Number 1: 1727-6903-2-ND
U6 = NTB0102DP-Q100H: Voltage Level Translator 2-CH Bidirectional Automotive 8-Pin TSSOP T/R; Manufacturer: NXP Semiconductors; Propagation Delay: 4.4ns; Data Rate: 100Mbps; Number of Channels: 2; Max Supply Voltage: 3.6V; Min Supply Voltage: 1.2V; Max Power Dissipation: 250mW; Nominal Supply Current: 3.3uA; Number of Circuits: 1; Turn-On Delay Time: 5.9ns; Low Level Output Current: 20uA; High Level Output Current: -20uA; Supplier 1: Digi-Key; Manufacturer Part Number: NTB0102DP-Q100H; RoHS: Yes; Category: Logic Gates; Stock 1: 8500; Pricing 1: 1=1.30000, 10=1.16200, 25=1.10240, 100=1.06880 (USD); Mount: Surface Mount; Case/Package: TSSOP; Number of Pins: 8; Min Operating Temperature: -40°C; Max Operating Temperature: 125°C; Packaging: Tape and Reel; Package Quantity: 3000; Channel Type: Bidirectional; Logic Function: Translator; Number of Bits: 2; Output Type: Voltage; Radiation Hardening: No; RoHS Compliant: Yes; ComponentLink1URL: https://datasheet.ciiva.com/29887/ntb0102-q100-29887588.pdf?src-supplier=Avnet; ComponentLink1Description: https://datasheet.ciiva.com/29887/ntb0102-q100-29887588.pdf?src-supplier=Avnet; ComponentLink2URL: https://datasheet.ciiva.com/29615/ntb0102-q100-29615979.pdf?src-supplier=Digi-Key; ComponentLink2Description: https://datasheet.ciiva.com/29615/ntb0102-q100-29615979.pdf?src-supplier=Digi-Key; Supplier Part Number 1: 568-12374-6-ND

## Sheet 5-Accelerometer.SchDoc: Accessories
size A4; Organization: Unival Logistics; Address1: 550 S Hill St.; Address2: Suite 1607; Address3: Los Angeles, CA 90013; Revision: A; SheetNumber: 6; SheetTotal: 6
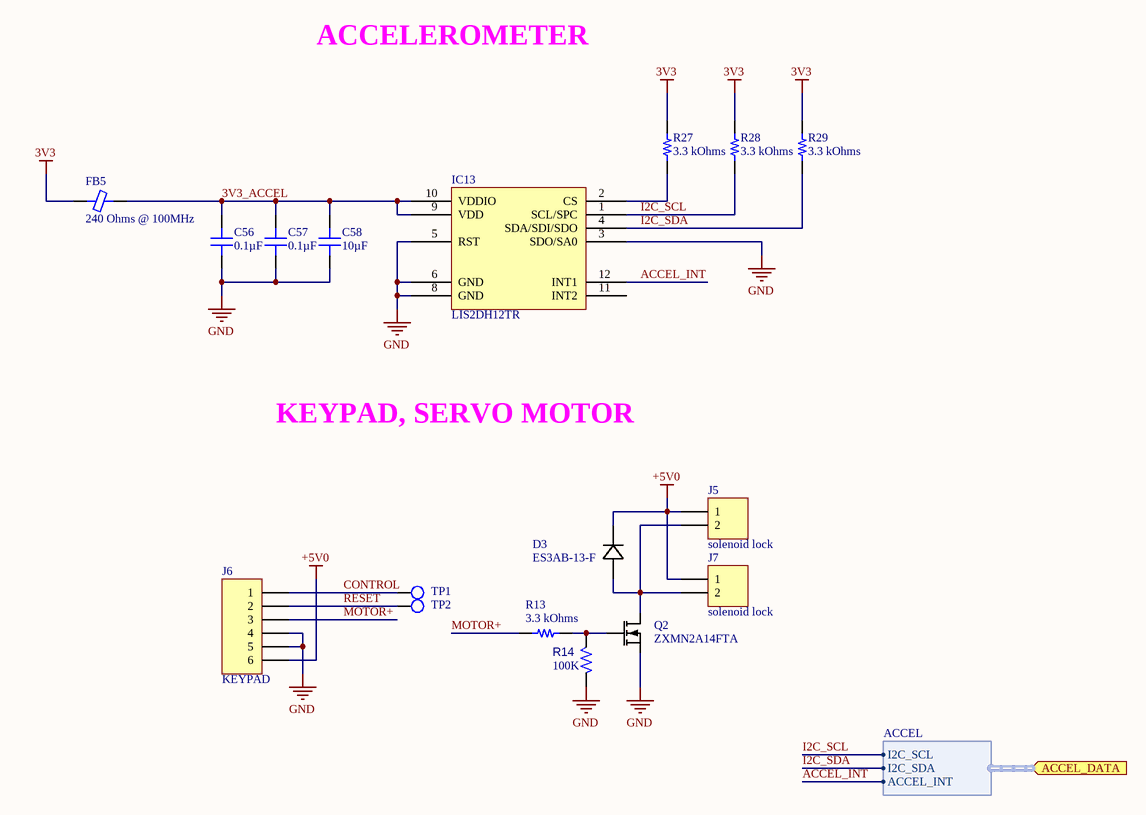
[diagram p4: 5-Accelerometer.SchDoc]

### Parts
C56  0.1µF  [CAP 0201_0603]
C57  0.1µF  [CAP 0201_0603]
C58  10µF  [CAP 0402_1005]
D3  ES3AB-13-F  [DIODE INC SMB]
FB5  240 Ohms @ 100MHz  [FER 0201_0603]
IC13  LIS2DH12TR  [ST LGA-12 2x2MM]
J5  solenoid lock  [MOLEX_282834-2]
J6  KEYPAD  [JST_B6B-PH-SM4-TB(LF)(SN)]
J7  solenoid lock  [MOLEX_282834-2]
Q2  ZXMN2A14FTA  [SOT-23]
R13  3.3 kOhms  [RES 0201_0603]
R14  100K  [RES 0201_0603]
R27  3.3 kOhms  [RES 0201_0603]
R28  3.3 kOhms  [RES 0201_0603]
R29  3.3 kOhms  [RES 0201_0603]
TP1  Test Point  [Test Point]  (value not drawn)  (no BOM)
TP2  Test Point  [Test Point]  (value not drawn)  (no BOM)

### Ports
ACCEL_DATA (in, harness ACCEL)

### Harnesses
ACCEL: I2C_SCL, I2C_SDA, ACCEL_INT

### Nets
3V3: FB5.1 R27.2 R28.2 R29.2
+5V0: D3.C J5.1 J6.6 J7.1
GND: C56.1 C57.1 C58.1 IC13.3(SDO/SA0) IC13.5(RST) IC13.6(GND) IC13.8(GND) J6.4 J6.5 Q2.2(S) R14.1
3V3_ACCEL: C56.2 C57.2 C58.2 FB5.2 IC13.9(VDD) IC13.10(VDDIO)
ACCEL_INT: IC13.12(INT1) ; port ACCEL_DATA.ACCEL_INT
CONTROL: J6.1 TP1.1(TP)
I2C_SCL: IC13.1(SCL/SPC) R28.1 ; port ACCEL_DATA.I2C_SCL
I2C_SDA: IC13.4(SDA/SDI/SDO) R29.1 ; port ACCEL_DATA.I2C_SDA
MOTOR+: J6.3 R13.2
RESET: J6.2 TP2.1(TP)
NetD3_A: D3.A J5.2 J7.2 Q2.3(D)
NetIC13_2: IC13.2(CS) R27.1
NetQ2_1: Q2.1(G) R13.1 R14.2

Not connected (* = marked no-connect by the designer): IC13 11(INT2)

### Notes on the sheet
- ACCELEROMETER
- KEYPAD, SERVO MOTOR
- Title
- Size:
- Date:
- A4
- Number:
- Time:
- Revision:
- Sheet
- of
- File:

### Library data of the parts
C56 C57 = Capacitor: as C40 on sheet 3-LTE Module; Value: 0.1µF; Applications: General Purpose; Capacitance: 0.1µF; ComponentLink1Description: Datasheet; ComponentLink1URL: https://search.murata.co.jp/Ceramy/image/img/A01X/G101/ENG/GRM033R61C104ME84-01.pdf; ComponentLink2Description: DigiKey Link; ComponentLink2URL: http://digikey.com/product-detail/en/murata-electronics/GRM033R61C104ME84D/490-9986-1-ND/5026291; Device Package: 0201 (0603 Metric); LastUpdated: 21/01/2020 00:00:12; Lifecycle Status: Active; Minimum Order: 1; Mounting Type: Surface Mount, MLCC; Operating Temperature: -55°C ~ 85°C; Package / Case: 0201 (0603 Metric); Packaging: TapeAndReel; PartId: 1522; Part Status: Active; Price: 0.01; Series: GRM; Size / Dimension: 0.024" L x 0.012" W (0.60mm x 0.30mm); Supplier 1: DigiKey; Supplier Part Number 1: 490-9986-1-ND; Temperature Coefficient: X5R; Thickness (Max): 0.013" (0.33mm); Voltage - Rated: 16V
C58 = Capacitor: CAP CER 10UF 6.3V X5R 0402; Part Number: GRM155R60J106ME15D; Manufacturer: Murata Electronics; Tolerance: ±20%; Value: 10µF; Applications: General Purpose; Capacitance: 10µF; ComponentLink1Description: Datasheet; ComponentLink1URL: https://www.murata.com/~/media/webrenewal/support/library/catalog/products/capacitor/mlcc/c02e.ashx?la=en-us; ComponentLink2Description: DigiKey Link; ComponentLink2URL: http://digikey.com/product-detail/en/murata-electronics/GRM155R60J106ME15D/490-13238-1-ND/5877446; Device Package: 0402 (1005 Metric); LastUpdated: 01/04/2020 23:56:51; Lifecycle Status: Active; Minimum Order: 1; Mounting Type: Surface Mount, MLCC; Operating Temperature: -55°C ~ 85°C; Package / Case: 0402 (1005 Metric); Packaging: TapeAndReel; PartId: 6754; Part Status: Active; Price: 0.03; Series: GRM; Size / Dimension: 0.039" L x 0.020" W (1.00mm x 0.50mm); Supplier 1: DigiKey; Supplier Part Number 1: 490-13238-1-ND; Temperature Coefficient: X5R; Thickness (Max): 0.026" (0.65mm); Voltage - Rated: 6.3V
D3 = 1N5819HW1-7-F: DIODE GEN PURP 50V 3A SMB; Manufacturer: Diodes Incorporated; Vendor: Comchip; Part Number: ES3AB-13-F; Digi-Key Part Number: ES3AB-FDITR-ND; Supplier: Digi-Key; Value: ES3AB-13-F
FB5 = Ferrite Chip: FERRITE BEAD 240 OHM 0201 1LN; Part Number: BK0603TS241-T; Manufacturer: Taiyo Yuden; Current Rating (Max): 400mA; DC Resistance (DCR) (Max): 320mOhm; Number of Lines: 1; ComponentLink1Description: Datasheet; ComponentLink1URL: https://ds.yuden.co.jp/TYCOMPAS/ut/detail?pn=BK0603TS241-T  &u=M; ComponentLink2Description: DigiKey Link; ComponentLink2URL: http://digikey.com/product-detail/en/taiyo-yuden/BK0603TS241-T/587-3276-1-ND/4157923; Device Package: 0201 (0603 Metric); Height (Max): 0.013" (0.33mm); Impedance @ Frequency: 240 Ohms @ 100MHz; LastUpdated: 21/01/2020 02:24:59; Lifecycle Status: Active; Minimum Order: 1; Mounting Type: Surface Mount; Operating Temperature: -55°C ~ 125°C; Package / Case: 0201 (0603 Metric); Packaging: TapeAndReel; PartId: 40; Part Status: Active; Price: 0.03; Series: BK; Size / Dimension: 0.024" L x 0.012" W (0.60mm x 0.30mm); Supplier 1: DigiKey; Supplier Part Number 1: 587-3276-1-ND; Value: 240 Ohms @ 100MHz
IC13 = ST LIS2DH12TR: ACCEL 2-16G I2C/SPI 12LGA; Manufacturer: STMicroelectronics; Acceleration Range: ±2g, 4g, 8g, 16g; Axis: X, Y, Z; Bandwidth: 0.5Hz ~ 672Hz; Output Type: I²C, SPI; Sensitivity (LSB/g): 1000 (±2g) ~ 83 (±16g); Voltage - Supply: 1.71V ~ 3.6V; Part Number: LIS2DH12TR; ComponentLink1Description: Datasheet; ComponentLink1URL: http://www.st.com/content/ccc/resource/technical/document/datasheet/12/c0/5c/36/b9/58/46/f2/DM00091513.pdf/files/DM00091513.pdf/jcr:content/translations/en.DM00091513.pdf; ComponentLink2Description: DigiKey Link; ComponentLink2URL: http://digikey.com/product-detail/en/stmicroelectronics/LIS2DH12TR/497-14851-1-ND/4899838; Device Package: 12-VFLGA; Features: Adjustable Bandwidth, Selectable Scale, Sleep Mode, Temperature Sensor; LastUpdated: 30/03/2020 15:41:11; Lifecycle Status: Active; Minimum Order: 1; Mounting Type: Surface Mount; Operating Temperature: -40°C ~ 85°C (TA); Package / Case: 12-VFLGA; Packaging: TapeAndReel; Part Status: Active; Price: 0.60; Series: -; Supplier 1: DigiKey; Supplier Part Number 1: 497-14851-1-ND; Supplier Device Package: 12-LGA (2x2); Type: Digital
J5 J7 = Header 2: TERM BLK 2P SIDE ENT 2.54MM PCB; Part Number: 282834-2; Manufacturer: TE Connectivity; Supplier Part Number 1: A98333-ND; Supplier 1: Digi-Key
J6 = Header 6: CONN HEADER SMD 6POS 2MM; Part Number: B6B-PH-SM4-TB(LF)(SN); Manufacturer: JST; Supplier Part Number 1: 455-1738-2-ND; Supplier 1: Digi-Key
Q2 = T:FET-N: MOSFET N-CH 20V 3.4A SOT23; Manufacturer: Diodes Incorporated; Part Number: ZXMN2A14FTA; Manufacturer Part Number: ZXMN2A14FTA; Value: ZXMN2A14FTA; Note: *; Supplier 1: Digi-Key; Supplier part number 1: ZXMN2A14FTR-ND
R13 R27-R29 = Resistor: RES SMD 3.3K OHM 1% 1/20W 0201; Part Number: ERJ-1GNF3301C; Manufacturer: Panasonic Electronic Components; Power (Watts): 0.05W, 1/20W; Temperature Coefficient: ±200ppm/°C; Value: 3.3 kOhms; ComponentLink1Description: Datasheet; ComponentLink1URL: https://industrial.panasonic.com/cdbs/www-data/pdf/RDA0000/AOA0000C304.pdf; ComponentLink2Description: DigiKey Link; ComponentLink2URL: http://digikey.com/product-detail/en/panasonic-electronic-components/ERJ-1GNF3301C/P122937CT-ND/8342813; Composition: Thick Film; Device Package: 0201 (0603 Metric); Features: Automotive AEC-Q200; Height - Seated (Max): 0.010" (0.26mm); LastUpdated: 21/01/2020 00:04:10; Lifecycle Status: Active; Minimum Order: 1; Number of Terminations: 2; Operating Temperature: -55°C ~ 125°C; Package / Case: 0201 (0603 Metric); Packaging: TapeAndReel; PartId: 4142; Part Status: Active; Price: 0.01; Ratings: AEC-Q200; Resistance: 3.3 kOhms; Series: ERJ; Size / Dimension: 0.024" L x 0.012" W (0.60mm x 0.30mm); Supplier 1: DigiKey; Supplier Part Number 1: P122937CT-ND; Supplier Device Package: 0201; Tolerance: ±1%
R14 = RSMT0626: as R18 on sheet 4-GPS; Value: 100K; Supplier Part Number 1: RMCF0201FT100KTR-ND; ComponentLink1URL: https://chn-vm-apps.microchip.com/mchprepo/parts/Datasheets/AOA0000CE2.pdf; ComponentLink1Description: Datasheet; Supplier 1: Digi-Key